# Altium project Master-Board-v2.0.PrjPcb (part 11 of 11)

## Sheet RS485-Sheet.SchDoc
size 420 x 297 mm; SheetNumber: 12; SheetTotal: 15
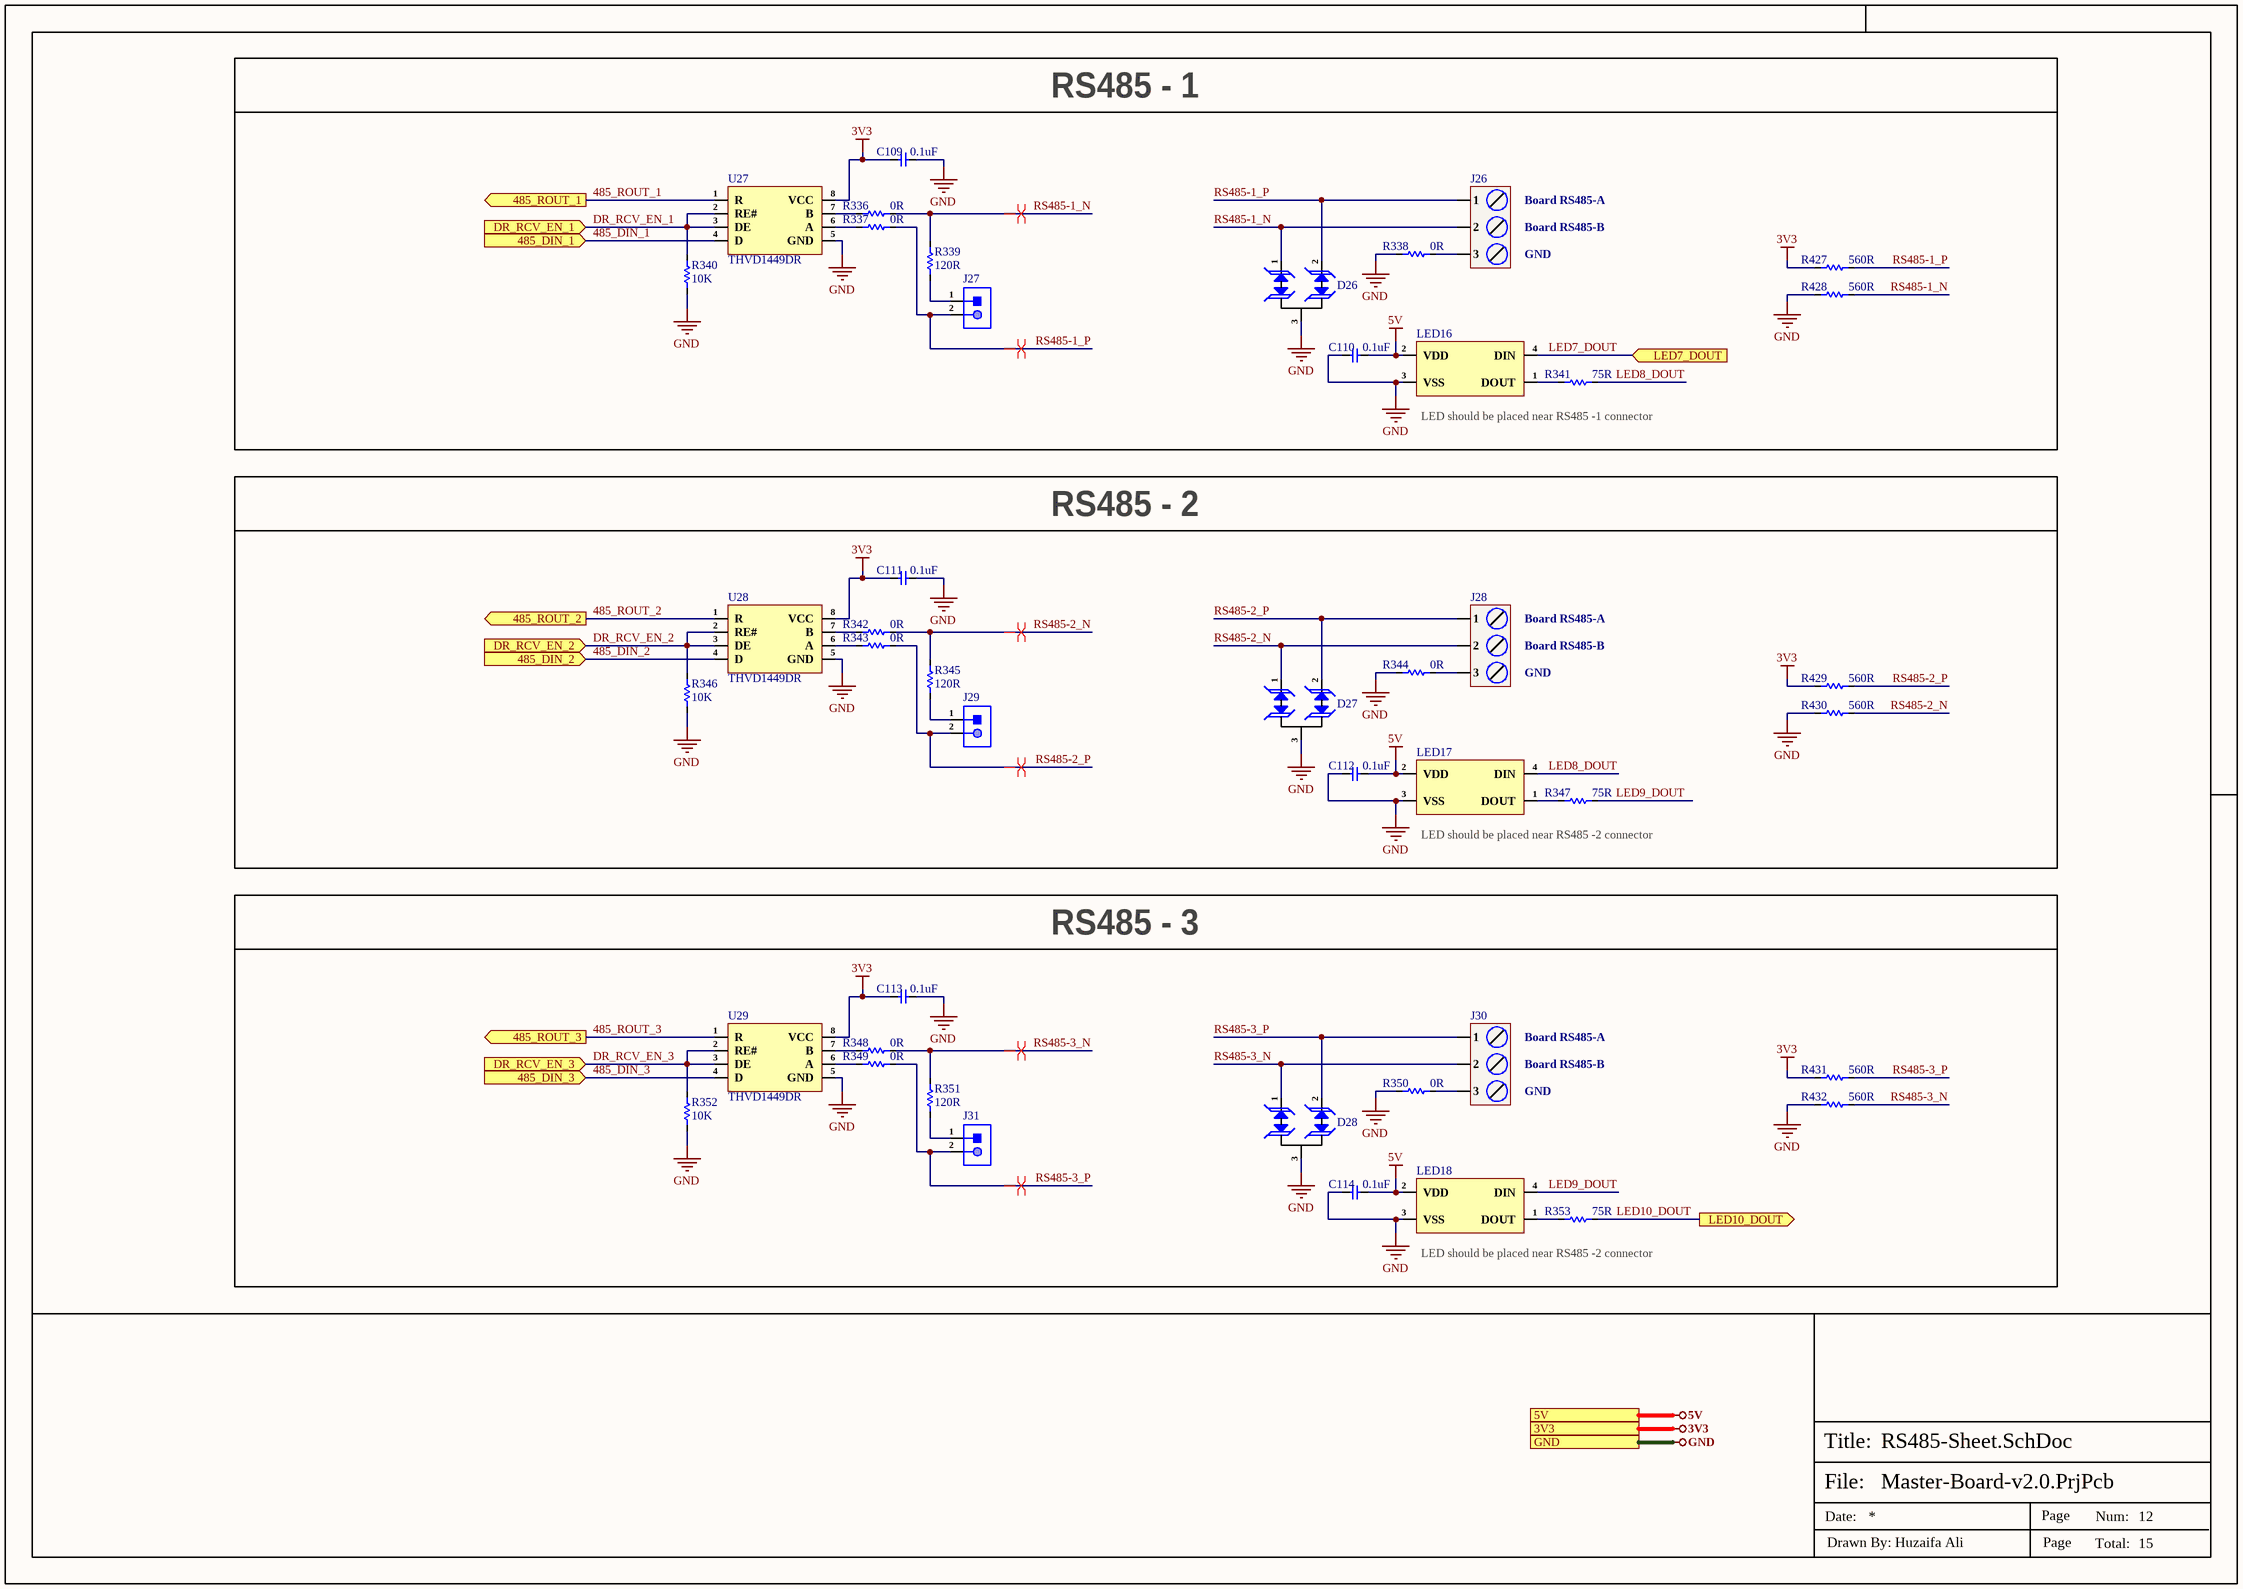
[diagram p13: RS485-Sheet.SchDoc]

### Parts
C109  0.1uF  [Cap-0402]
C110  0.1uF  [Cap-0402]
C111  0.1uF  [Cap-0402]
C112  0.1uF  [Cap-0402]
C113  0.1uF  [Cap-0402]
C114  0.1uF  [Cap-0402]
D26  SM712  [SOT-23]  (value not drawn)
D27  SM712  [SOT-23]  (value not drawn)
D28  SM712  [SOT-23]  (value not drawn)
J26  DB128L-5.08-3P-GY-S  [DB128L-5.08-3P-GY-S]  (value not drawn)
J27  X6511WV-02H-C60D30  [HDR1X2_]  (value not drawn)
J28  DB128L-5.08-3P-GY-S  [DB128L-5.08-3P-GY-S]  (value not drawn)
J29  X6511WV-02H-C60D30  [HDR1X2_]  (value not drawn)
J30  DB128L-5.08-3P-GY-S  [DB128L-5.08-3P-GY-S]  (value not drawn)
J31  X6511WV-02H-C60D30  [HDR1X2_]  (value not drawn)
LED16  WS2812D-F5  [WS2812D-F5]  (value not drawn)
LED17  WS2812D-F5  [WS2812D-F5]  (value not drawn)
LED18  WS2812D-F5  [WS2812D-F5]  (value not drawn)
R336  0R  [Res-0402]
R337  0R  [Res-0402]
R338  0R  [Res-0402]
R339  120R  [Res-0603]
R340  10K  [Res-0402]
R341  75R  [Res-0402]
R342  0R  [Res-0402]
R343  0R  [Res-0402]
R344  0R  [Res-0402]
R345  120R  [Res-0603]
R346  10K  [Res-0402]
R347  75R  [Res-0402]
R348  0R  [Res-0402]
R349  0R  [Res-0402]
R350  0R  [Res-0402]
R351  120R  [Res-0603]
R352  10K  [Res-0402]
R353  75R  [Res-0402]
R427  560R  [Res-0402]
R428  560R  [Res-0402]
R429  560R  [Res-0402]
R430  560R  [Res-0402]
R431  560R  [Res-0402]
R432  560R  [Res-0402]
U27  THVD1449DR  [SOIC-8(0.154", 3.90mm Width)]
U28  THVD1449DR  [SOIC-8(0.154", 3.90mm Width)]
U29  THVD1449DR  [SOIC-8(0.154", 3.90mm Width)]

### Blocks framed on the sheet
RS485 - 1: C109 C110 D26 J26 J27 LED16 R336-R341 R427 R428 U27
RS485 - 2: C111 C112 D27 J28 J29 LED17 R342-R347 R429 R430 U28
RS485 - 3: C113 C114 D28 J30 J31 LED18 R348-R353 R431 R432 U29

### Ports
3V3 (see Top-Sheet[2D], CAN-Sheet[5D], Controller-Sheet-1[4D], Controller-Sheet-2[4D], Controller-Sheet-3[4D], DIOs-Lights-Sensors-Sheet[4D], Display-Sheet[5D], ESP32_Sheet[6D], EtherCAT-Sheet[1D], Ethernet-Sheet[5D], Power-Sheet[4D], RS232-Sheet[5D], STM32-USB-Sheet[4D]), 5V (see Top-Sheet[2D], Analog-AIO-Sheet[5D], CAN-Sheet[5D], Controller-Sheet-2[4D], Controller-Sheet-3[4D], DIOs-Lights-Sensors-Sheet[4D], Display-Sheet[5D], Power-Sheet[4D], RS232-Sheet[5D], STM32-USB-Sheet[4D]), 485_DIN_1 (in, see Top-Sheet[2D]), 485_DIN_2 (in, see Top-Sheet[2D]), 485_DIN_3 (in, see Top-Sheet[2D]), 485_ROUT_1 (out, see Top-Sheet[2D]), 485_ROUT_2 (out, see Top-Sheet[2D]), 485_ROUT_3 (out, see Top-Sheet[2D]), DR_RCV_EN_1 (in, see Top-Sheet[2D]), DR_RCV_EN_2 (in, see Top-Sheet[2D]), DR_RCV_EN_3 (in, see Top-Sheet[2D]), GND (see Top-Sheet[2D], Analog-AIO-Sheet[5D], CAN-Sheet[6D], Controller-Sheet-1[4D], Controller-Sheet-2[4D], Controller-Sheet-3[4D], DIOs-Lights-Sensors-Sheet[4D], Display-Sheet[5D], ESP32_Sheet[6D], EtherCAT-Sheet[1D], Ethernet-Sheet[5D], Power-Sheet[4D], RS232-Sheet[5D], STM32-USB-Sheet[4D]), LED7_DOUT (in, see Top-Sheet[2D], RS232-Sheet[5C]), LED10_DOUT (out, see Top-Sheet[2D])

### Nets
3V3: C109.2 C111.2 C113.2 R427.2 R429.2 R431.2 U27.8(VCC) U28.8(VCC) U29.8(VCC) ; port 3V3
5V: C110.2 C112.2 C114.2 LED16.2(VDD) LED17.2(VDD) LED18.2(VDD) ; port 5V
GND: C109.1 C110.1 C111.1 C112.1 C113.1 C114.1 D26.3(GND) D27.3(GND) D28.3(GND) LED16.3(VSS) LED17.3(VSS) LED18.3(VSS) R338.1 R340.2 R344.1 R346.2 R350.1 R352.2 R428.2 R430.2 R432.2 U27.5(GND) U28.5(GND) U29.5(GND) ; port GND
485_DIN_1: U27.4(D) ; port 485_DIN_1
485_DIN_2: U28.4(D) ; port 485_DIN_2
485_DIN_3: U29.4(D) ; port 485_DIN_3
485_ROUT_1: U27.1(R) ; port 485_ROUT_1
485_ROUT_2: U28.1(R) ; port 485_ROUT_2
485_ROUT_3: U29.1(R) ; port 485_ROUT_3
DR_RCV_EN_1: R340.1 U27.2(RE#) U27.3(DE) ; port DR_RCV_EN_1  [project net DO_PF10]
DR_RCV_EN_2: R346.1 U28.2(RE#) U28.3(DE) ; port DR_RCV_EN_2  [project net DO_PF11]
DR_RCV_EN_3: R352.1 U29.2(RE#) U29.3(DE) ; port DR_RCV_EN_3  [project net DO_PF12]
LED7_DOUT: LED16.4(DIN) ; port LED7_DOUT
LED8_DOUT: LED17.4(DIN) R341.2
LED9_DOUT: LED18.4(DIN) R347.2
LED10_DOUT: R353.2 ; port LED10_DOUT
RS485-1_N: D26.1(I/O1) J26.2 R336.2 R339.2 R428.1
RS485-1_P: D26.2(I/O2) J26.1 J27.2 R337.2 R427.1
RS485-2_N: D27.1(I/O1) J28.2 R342.2 R345.2 R430.1
RS485-2_P: D27.2(I/O2) J28.1 J29.2 R343.2 R429.1
RS485-3_N: D28.1(I/O1) J30.2 R348.2 R351.2 R432.1
RS485-3_P: D28.2(I/O2) J30.1 J31.2 R349.2 R431.1
NetJ26_3: J26.3 R338.2
NetJ27_1: J27.1 R339.1
NetJ28_3: J28.3 R344.2
NetJ29_1: J29.1 R345.1
NetJ30_3: J30.3 R350.2
NetJ31_1: J31.1 R351.1
NetLED16_1: LED16.1(DOUT) R341.1
NetLED17_1: LED17.1(DOUT) R347.1
NetLED18_1: LED18.1(DOUT) R353.1
NetR336_1: R336.1 U27.7(B)
NetR337_1: R337.1 U27.6(A)
NetR342_1: R342.1 U28.7(B)
NetR343_1: R343.1 U28.6(A)
NetR348_1: R348.1 U29.7(B)
NetR349_1: R349.1 U29.6(A)

### Layout directives
differential pair; differential pair class RS485: RS485-1_N, RS485-1_P, RS485-2_N, RS485-2_P, RS485-3_N, RS485-3_P

### Notes on the sheet
- Board RS485-A
- Board RS485-B
- GND
- LED should be placed near RS485 -1 connector
- LED should be placed near RS485 -2 connector
- File:
- Title:
- Date:
- Page
- Num:
- Total:
- Drawn By: Huzaifa Ali

### Library data of the parts
C109-C114 = CC0402JRX7R7BB104: as C115-C124 on sheet EtherCAT-Sheet; Supplier: Digikey; Supplier Part Number: 311-1676-1-ND; Manufacturer Part Number: CC0402JRX7R7BB104; RoHS: Yes; Category: Ceramic Capacitors; Stock: 1659111; Pricing: 1=0.1, 10=0.046, 50=0.0262, 100=0.0203, 500=0.01528, 1000=0.012, 2500=0.01091, 5000=0.01004 (USD); Mounting Technology: Surface Mount; Case/Package: 0402; Case Code (Metric): 1005; Case Code (Imperial): 0402; Min Operating Temperature: -55°C; Max Operating Temperature: 125°C; Dielectric: X7R; Packaging: Tape and Reel; Package Quantity: 10000; Voltage Rating (DC): 16V; Voltage Rating: 16V; Series: CC; Construction: Flat; Length: 0.039inch; Width: 0.02inch; Height: 0.5mm; Thickness: 0.022inch; Lead Free: Lead Free; Halogen Free: Halogen Free; RoHS Compliant: Yes; ComponentLink1URL: https://datasheet.ciiva.com/13210/upy-gphc-x7r-6-3v-to-50v-8-12304-13210152.pdf?src-supplier=Mouser; ComponentLink1Description: https://datasheet.ciiva.com/13210/upy-gphc-x7r-6-3v-to-50v-8-12304-13210152.pdf?src-supplier=Mouser; LCSC Part Number: C541464
D26-D28 = SM712: SOT-23 TVS ROHS; Manufacturer: TECH PUBLIC; Item Type: Diode; Manufacturer Part Number: SM712; Package: SOT-23; LCSC Part Number: C521963; ComponentLink1Description: LCSC; ComponentLink1URL: https://www.lcsc.com/product-detail/TVS_TECH-PUBLIC-SM712_C521963.html
J26 J28 J30 = DB128L-5.08-3P-GY-S: 1x3P 20A -40℃~+105℃ 300V Gray 12~30 Direct Insert 5.08mm 1~2.5 1 3 Plugin,P=5.08mm Screw Terminal Blocks ROHS; Manufacturer: DORABO; Manufacturer Part Number: DB128L-5.08-3P-GY-S; Package: Plugin,P=5.08mm; LCSC Part Number: C500022; Item Type: Terminal Block; ComponentLink1Description: LCSC; ComponentLink1URL: https://www.lcsc.com/product-detail/Screw-Terminal-Blocks_DORABO-DB128L-5-08-3P-GY-S_C500022.html
J27 J29 J31 = X6511WV-02H-C60D30: Gold 250V 3A Straight Square Pins 2.5mm 2P 260℃ 6mm -40℃~+105℃ 3mm 2.54mm Plugin Black Brass 1x2P Plugin,P=2.54mm Pin Headers ROHS; Manufacturer: XKB; Item Type: Male Header; Manufacturer Part Number: X6511WV-02H-C60D30; Package: Plugin,P=2.54mm; LCSC Part Number: C706874; ComponentLink1Description: LCSC; ComponentLink1URL: https://www.lcsc.com/product-detail/Pin-Headers_XKB-Connectivity-X6511WV-02H-C60D30_C706874.html
LED16-LED18 = WS2812D-F5: Plugin,D=5mm RGB LEDs ROHS; Manufacturer: Worldsemi; Item Type: RGB LED; Manufacturer Part Number: WS2812D-F5; Package: Plugin,D=5mm; LCSC Part Number: C190565; ComponentLink1Description: LCSC; ComponentLink1URL: https://jlcpcb.com/partdetail/Worldsemi-WS2812DF5/C190565
R336-R338 R342-R344 R348-R350 = RC0402FR-070RL: as R359 on sheet EtherCAT-Sheet; Supplier 1: Mouser; Manufacturer Part Number: RC0402FR-070RL; RoHS: Yes; Stock 1: 8556842; Pricing 1: 1=0.10000, 10=0.01400, 50=0.01400, 100=0.00600, 1000=0.00300, 5000=0.00200, 10000=0.00100 (USD); Mount: Surface Mount; Case/Package: 0402; Contact Plating: Tin,Matte; Case Code (Imperial): 0402; Case Code (Metric): 1005; Size Code: 0402; Min Operating Temperature: -55°C; Max Operating Temperature: 155°C; Resistance: 0R; Resistor Type: Thick Film; Packaging: Tape and Reel; Termination: SMD/SMT; Features: Moisture Resistant; Series: RC; Number of Terminations: 2; Length: 1mm; Width: 0.5mm; Height: 0.35mm; Radiation Hardening: No; Lead Free: Lead Free; RoHS Compliant: Yes; ComponentLink1URL: https://datasheet.ciiva.com/8896/pyu-rc0402-51-rohs-l-6-8896149.pdf?src-supplier=Avnet; ComponentLink1Description: https://datasheet.ciiva.com/8896/pyu-rc0402-51-rohs-l-6-8896149.pdf?src-supplier=Avnet; ComponentLink2URL: https://datasheet.ciiva.com/16790/pyu-rc0402-51-rohs-l-6-r-16790444.pdf?src-supplier=Future+Electronics; ComponentLink2Description: https://datasheet.ciiva.com/16790/pyu-rc0402-51-rohs-l-6-r-16790444.pdf?src-supplier=Future+Electronics; Supplier Part Number 1: 603-RC0402FR-070RL; LCSC Part Number: C106231
R339 R345 R351 = RC0603FR-07120RL: RES 120 OHM 1% 1/10W 0603; Manufacturer: Yageo; Temperature Coefficient: 100ppm/°C; Voltage Rating (DC): 50V; Power Rating: 100mW; Item Type: Resistor; Supplier 1: Digi-Key; Manufacturer Part Number: RC0603FR-07120RL; RoHS: Yes; Category: Chip SMD Resistors; Stock 1: 839061; Pricing 1: 1=0.10000, 10=0.02400, 100=0.00970, 1000=0.00436, 2500=0.00378 (USD); Case/Package: 0603; Number of Pins: 2; Case Code (Metric): 1608; Case Code (Imperial): 0603; Size Code: 0603; Min Operating Temperature: -55°C; Max Operating Temperature: 155°C; Resistance: 120R; Tolerance: 1%; Resistor Type: Thick Film; Packaging: Tape and Reel; Voltage Rating: 50V; Package Quantity: 1; Number of Terminations: 2; Termination: SMD/SMT; Max Power Dissipation: 100mW; Features: Moisture Resistant; Series: RC; Construction: Rectangular; Resistance Tolerance: 1%; Length: 1.6mm; Width: 0.031inch; Height: 0.022inch; Depth: 0.8mm; REACH SVHC: No SVHC; Lead Free: Lead Free; Military Standard: Not; RoHS Compliant: Yes; ComponentLink1URL: https://datasheet.ciiva.com/2553/pyu-r-int-thick-7-2553512.pdf?src-supplier=Digi-Key; ComponentLink1Description: https://datasheet.ciiva.com/2553/pyu-r-int-thick-7-2553512.pdf?src-supplier=Digi-Key; ComponentLink2URL: https://datasheet.ciiva.com/7746/443971-7746248.pdf?src-supplier=Element14; ComponentLink2Description: https://datasheet.ciiva.com/7746/443971-7746248.pdf?src-supplier=Element14; ComponentLink3URL: https://datasheet.ciiva.com/2553/pyu-r-int-thick-7-2553513.pdf?src-supplier=Digi-Key; ComponentLink3Description: https://datasheet.ciiva.com/2553/pyu-r-int-thick-7-2553513.pdf?src-supplier=Digi-Key; ComponentLink4URL: https://datasheet.ciiva.com/7746/443971-7746249.pdf?src-supplier=Element14; ComponentLink4Description: https://datasheet.ciiva.com/7746/443971-7746249.pdf?src-supplier=Element14; ComponentLink5URL: https://datasheet.ciiva.com/2553/pyu-r-int-thick-7-2553514.pdf?src-supplier=Digi-Key; ComponentLink5Description: https://datasheet.ciiva.com/2553/pyu-r-int-thick-7-2553514.pdf?src-supplier=Digi-Key; ComponentLink6URL: https://datasheet.ciiva.com/46395/443971-46395021.pdf?src-supplier=Element14; ComponentLink6Description: https://datasheet.ciiva.com/46395/443971-46395021.pdf?src-supplier=Element14; Supplier Part Number 1: 311-120HRCT-ND; LCSC Part Number: C114640
R340 R346 R352 = RC0402FR-0710KL: as R354 on sheet EtherCAT-Sheet; Supplier 1: Mouser; Manufacturer Part Number: RC0402FR-0710KL; RoHS: Yes; Category: Chip SMD Resistors; Stock 1: 18648329; Pricing 1: 1=0.10000, 10=0.01400, 50=0.01400, 100=0.00500, 1000=0.00300, 10000=0.00200 (USD); Case/Package: 0402; Number of Pins: 2; Case Code (Imperial): 0402; Case Code (Metric): 1005; Min Operating Temperature: -55°C; Max Operating Temperature: 155°C; Resistor Type: Thick Film; Tolerance: 1%; Packaging: Tape and Reel; Voltage Rating: 50V; Termination: SMD/SMT; Working Voltage: 50V; Number of Terminations: 2; Features: Moisture Resistant; Series: RC; Resistance Tolerance: 1%; Construction: Rectangular; Length: 1mm; Width: 0.5mm; Height: 0.32mm; Depth: 0.5mm; Lead Pitch: 0.2mm; REACH SVHC: No SVHC; Lead Free: Lead Free; RoHS Compliant: Yes; Military Standard: Not; ComponentLink1URL: https://datasheet.ciiva.com/7660/38568-7660787.pdf?src-supplier=Element14; ComponentLink1Description: https://datasheet.ciiva.com/7660/38568-7660787.pdf?src-supplier=Element14; ComponentLink2URL: https://datasheet.ciiva.com/7849/1686128-7849814.pdf?src-supplier=Element14; ComponentLink2Description: https://datasheet.ciiva.com/7849/1686128-7849814.pdf?src-supplier=Element14; ComponentLink3URL: https://datasheet.ciiva.com/7983/1018594-7983486.pdf?src-supplier=Element14; ComponentLink3Description: https://datasheet.ciiva.com/7983/1018594-7983486.pdf?src-supplier=Element14; ComponentLink4URL: https://datasheet.ciiva.com/22747/1018594-22747512.pdf?src-supplier=Element14; ComponentLink4Description: https://datasheet.ciiva.com/22747/1018594-22747512.pdf?src-supplier=Element14; ComponentLink5URL: https://datasheet.ciiva.com/12667/pyu-rc0402-51-rohs-l-6-r-12667067.pdf?src-supplier=Mouser; ComponentLink5Description: https://datasheet.ciiva.com/12667/pyu-rc0402-51-rohs-l-6-r-12667067.pdf?src-supplier=Mouser; ComponentLink6URL: https://datasheet.ciiva.com/7849/1784430-7849813.pdf?src-supplier=Element14; ComponentLink6Description: https://datasheet.ciiva.com/7849/1784430-7849813.pdf?src-supplier=Element14; ComponentLink7URL: https://datasheet.ciiva.com/7849/1784430-7849815.pdf?src-supplier=Element14; ComponentLink7Description: https://datasheet.ciiva.com/7849/1784430-7849815.pdf?src-supplier=Element14; Supplier Part Number 1: 603-RC0402FR-0710KL; LCSC Part Number: C60490
R341 R347 R353 = RC0402JR-0775RL: RES 75 OHM 5% 1/16W 0402; Manufacturer: Yageo; Item Type: Resistor; Temperature Coefficient: 100ppm/°C; Power Rating: 62.5mW; Voltage Rating: 50V; Max Power Dissipation: 63mW; Supplier: Digikey; Supplier Part Number: 311-75JRCT-ND; Manufacturer Part Number: RC0402JR-0775RL; RoHS: Yes; Stock: 2993323; Pricing: 1=0.1, 10=0.018, 50=0.0102, 100=0.0083, 500=0.00528, 1000=0.00444, 5000=0.00307 (USD); Case/Package: 0402; Pins: 2; Contact Plating: Tin,Lead; Case Code (Imperial): 0402; Case Code (Metric): 1005; Min Operating Temperature: -55°C; Max Operating Temperature: 155°C; Value: 75R; Tolerance: 5%; Resistor Type: Thick Film; Packaging: Tape and Reel; Termination: SMD/SMT; Voltage Rating (DC): 50V; Features: Moisture Resistant; Series: RC; Number of Terminations: 2; Resistance Tolerance: 5%; Length: 1mm; Width: 0.5mm; Height: 0.35mm; Reach SVHC Compliant: No; Lead Free: Lead Free; RoHS Compliant: Yes; ComponentLink1URL: https://datasheet.ciiva.com/7983/1018594-7983612.pdf?src-supplier=Element14; ComponentLink1Description: https://datasheet.ciiva.com/7983/1018594-7983612.pdf?src-supplier=Element14; ComponentLink2URL: https://datasheet.ciiva.com/17082/pyu-rc0402-51-rohs-l-6-r-17082239.pdf?src-supplier=Future+Electronics; ComponentLink2Description: https://datasheet.ciiva.com/17082/pyu-rc0402-51-rohs-l-6-r-17082239.pdf?src-supplier=Future+Electronics; LCSC Part Number: C137841
R427-R432 = RC0402FR-07560RL: RES 560 OHM 1% 1/16W 0402; Manufacturer: Yageo; Power Rating: 63mW; Temperature Coefficient: 100ppm/°C; Voltage Rating: 50V; Item Type: Resistor; Supplier: Future Electronics; Supplier Part Number: 8872046; Manufacturer Part Number: RC0402FR-07560RL; RoHS: Yes; Category: Chip SMD Resistors; Stock: 1360000; Pricing: 10000=0.0012, 100000=0.0011, 300000=0.0011, 1250000=0.001, 3000000=0.0009 (USD); Case/Package: 0402; Case Code (Metric): 1005; Case Code (Imperial): 0402; Min Operating Temperature: -55°C; Max Operating Temperature: 155°C; Tolerance: 1%; Packaging: Tape and Reel; Value: 560R; Package Quantity: 1; Resistor Type: Thick Film; Number of Terminations: 2; Termination: SMD/SMT; Max Power Dissipation: 63mW; Features: Moisture Resistant; Series: RC; Construction: Rectangular; Resistance Tolerance: 1%; Length: 1mm; Width: 0.02inch; Height: 0.016inch; Depth: 0.5mm; RoHS Compliant: Yes; Military Standard: Not; Lead Free: Lead Free; Reach SVHC Compliant: Unknown; ComponentLink1URL: https://datasheet.ciiva.com/2453/pyu-r-int-thick-7-2453458.pdf?src-supplier=Digikey; ComponentLink1Description: https://datasheet.ciiva.com/2453/pyu-r-int-thick-7-2453458.pdf?src-supplier=Digikey; ComponentLink2URL: https://datasheet.ciiva.com/2453/pyu-r-int-thick-7-2453459.pdf?src-supplier=Digikey; ComponentLink2Description: https://datasheet.ciiva.com/2453/pyu-r-int-thick-7-2453459.pdf?src-supplier=Digikey; ComponentLink3URL: https://datasheet.ciiva.com/2453/pyu-r-int-thick-7-2453457.pdf?src-supplier=Digikey; ComponentLink3Description: https://datasheet.ciiva.com/2453/pyu-r-int-thick-7-2453457.pdf?src-supplier=Digikey; ComponentLink4URL: https://datasheet.ciiva.com/12558/pyu-rc0402-51-rohs-l-6-r-8721-12558383.pdf?src-supplier=Mouser; ComponentLink4Description: https://datasheet.ciiva.com/12558/pyu-rc0402-51-rohs-l-6-r-8721-12558383.pdf?src-supplier=Mouser; ComponentLink5URL: https://datasheet.ciiva.com/7850/1018594-7850042.pdf?src-supplier=Element14; ComponentLink5Description: https://datasheet.ciiva.com/7850/1018594-7850042.pdf?src-supplier=Element14; ComponentLink6URL: https://datasheet.ciiva.com/7850/1018594-7850043.pdf?src-supplier=Element14; ComponentLink6Description: https://datasheet.ciiva.com/7850/1018594-7850043.pdf?src-supplier=Element14; LCSC Part Number: C163460
U27-U29 = THVD1449DR: IC TRANSCEIVER HALF 1/1 8SOIC; Manufacturer: Texas Instruments; Supplier: Mouser; LCSC Part Number: C3235059; Manufacturer Part Number: THVD1449DR; RoHS: No; Item Type: IC; Stock: 7454; Pricing: 1=3.62, 10=2.51, 50=2.51, 100=2.27, 1000=2.02, 10000=1.95 (USD)

## Sheet RS232-Sheet.SchDoc
size 420 x 297 mm; SheetNumber: 11; SheetTotal: 15
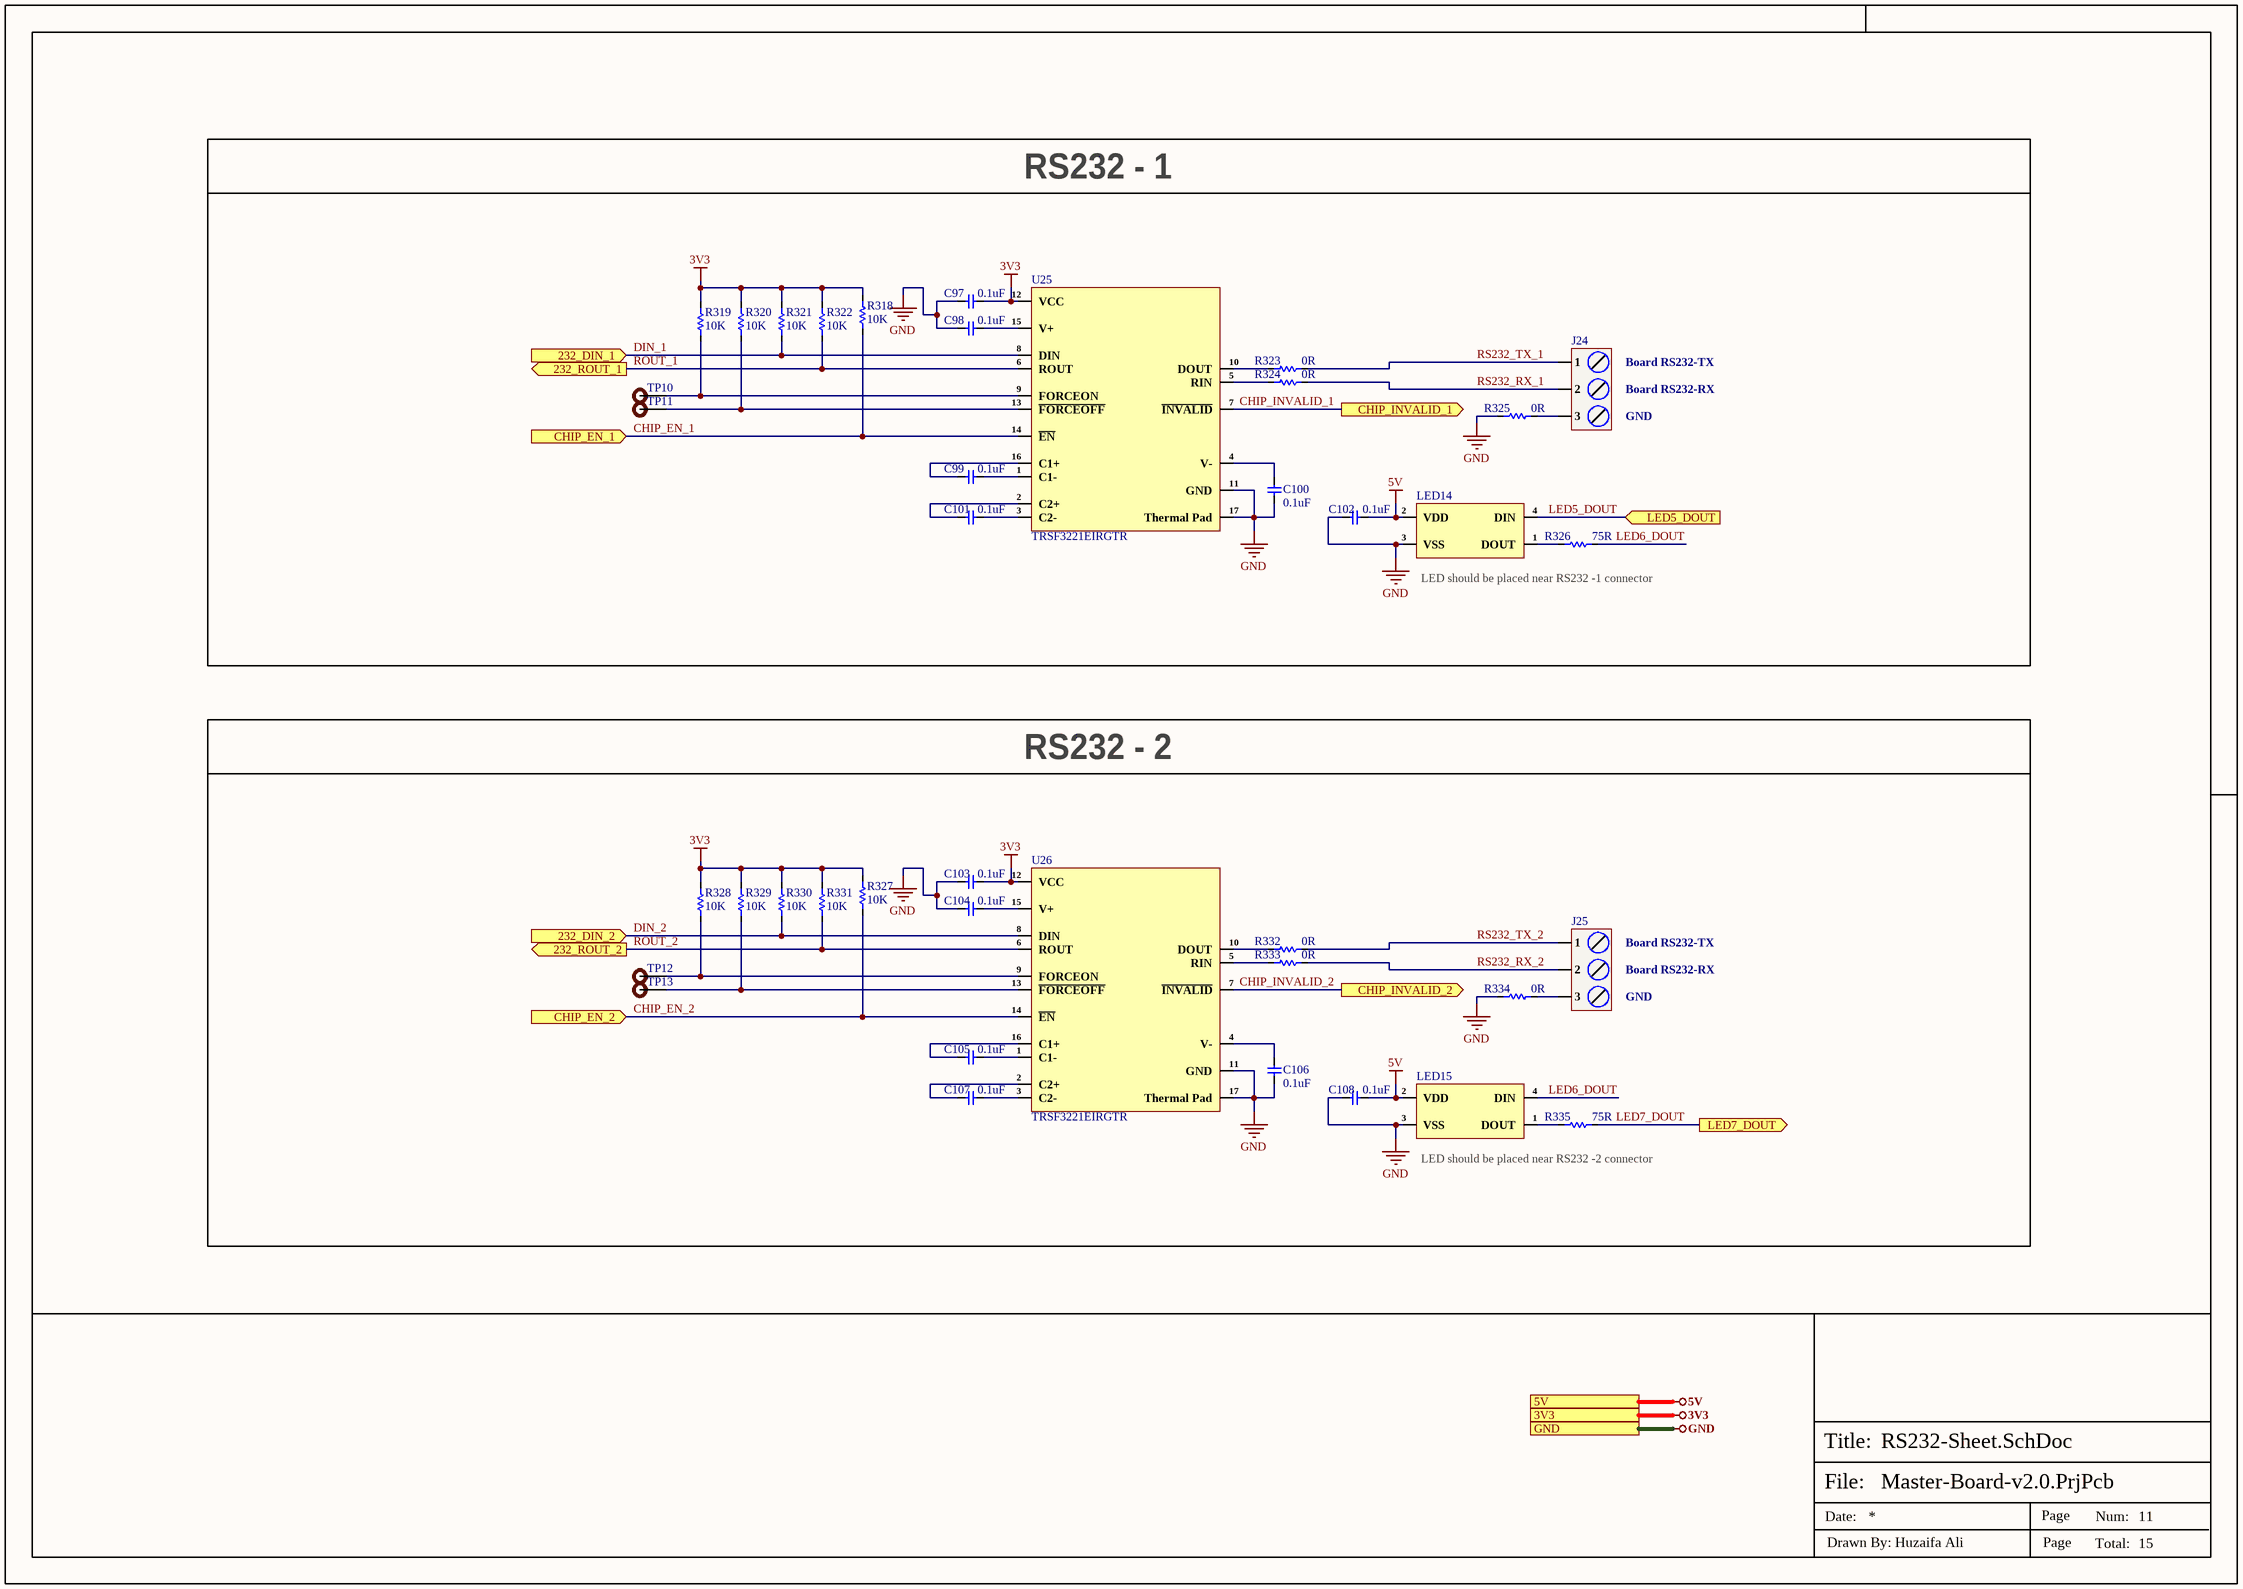
[diagram p14: RS232-Sheet.SchDoc]

### Parts
C97  0.1uF  [Cap-0402]
C98  0.1uF  [Cap-0402]
C99  0.1uF  [Cap-0402]
C100  0.1uF  [Cap-0402]
C101  0.1uF  [Cap-0402]
C102  0.1uF  [Cap-0402]
C103  0.1uF  [Cap-0402]
C104  0.1uF  [Cap-0402]
C105  0.1uF  [Cap-0402]
C106  0.1uF  [Cap-0402]
C107  0.1uF  [Cap-0402]
C108  0.1uF  [Cap-0402]
J24  DB128L-5.08-3P-GN-S  [DB128L-5.08-3P-GN-S]  (value not drawn)
J25  DB128L-5.08-3P-GN-S  [DB128L-5.08-3P-GN-S]  (value not drawn)
LED14  WS2812D-F5  [WS2812D-F5]  (value not drawn)
LED15  WS2812D-F5  [WS2812D-F5]  (value not drawn)
R318  10K  [Res-0402]
R319  10K  [Res-0402]
R320  10K  [Res-0402]
R321  10K  [Res-0402]
R322  10K  [Res-0402]
R323  0R  [Res-0402]
R324  0R  [Res-0402]
R325  0R  [Res-0402]
R326  75R  [Res-0402]
R327  10K  [Res-0402]
R328  10K  [Res-0402]
R329  10K  [Res-0402]
R330  10K  [Res-0402]
R331  10K  [Res-0402]
R332  0R  [Res-0402]
R333  0R  [Res-0402]
R334  0R  [Res-0402]
R335  75R  [Res-0402]
TP10  TEST POINT  [Test-point]  (value not drawn)  (no BOM)
TP11  TEST POINT  [Test-point]  (value not drawn)  (no BOM)
TP12  TEST POINT  [Test-point]  (value not drawn)  (no BOM)
TP13  TEST POINT  [Test-point]  (value not drawn)  (no BOM)
U25  TRSF3221EIRGTR  [16-QFN (3x3).]
U26  TRSF3221EIRGTR  [16-QFN (3x3).]

### Blocks framed on the sheet
RS232 - 1: C97-C102 J24 LED14 R318-R326 TP10 TP11 U25
RS232 - 2: C103-C108 J25 LED15 R327-R335 TP12 TP13 U26

### Ports
3V3 (see Top-Sheet[5B], CAN-Sheet[5D], Controller-Sheet-1[4D], Controller-Sheet-2[4D], Controller-Sheet-3[4D], DIOs-Lights-Sensors-Sheet[4D], Display-Sheet[5D], ESP32_Sheet[6D], EtherCAT-Sheet[1D], Ethernet-Sheet[5D], Power-Sheet[4D], RS485-Sheet[5D], STM32-USB-Sheet[4D]), 5V (see Top-Sheet[5B], Analog-AIO-Sheet[5D], CAN-Sheet[5D], Controller-Sheet-2[4D], Controller-Sheet-3[4D], DIOs-Lights-Sensors-Sheet[4D], Display-Sheet[5D], Power-Sheet[4D], RS485-Sheet[5D], STM32-USB-Sheet[4D]), 232_DIN_1 (in, see Top-Sheet[5B]), 232_DIN_2 (in, see Top-Sheet[5B]), 232_ROUT_1 (out, see Top-Sheet[5B]), 232_ROUT_2 (out, see Top-Sheet[5B]), CHIP_EN_1 (in, see Top-Sheet[5B]), CHIP_EN_2 (in, see Top-Sheet[5B]), CHIP_INVALID_1 (out, see Top-Sheet[5B]), CHIP_INVALID_2 (out, see Top-Sheet[5B]), GND (see Top-Sheet[5B], Analog-AIO-Sheet[5D], CAN-Sheet[6D], Controller-Sheet-1[4D], Controller-Sheet-2[4D], Controller-Sheet-3[4D], DIOs-Lights-Sensors-Sheet[4D], Display-Sheet[5D], ESP32_Sheet[6D], EtherCAT-Sheet[1D], Ethernet-Sheet[5D], Power-Sheet[4D], RS485-Sheet[5D], STM32-USB-Sheet[4D]), LED5_DOUT (in, see Top-Sheet[5B], CAN-Sheet[5D]), LED7_DOUT (out, see Top-Sheet[5B], RS485-Sheet[5A])

### Nets
3V3: C97.1 C103.1 R318.1 R319.1 R320.1 R321.1 R322.1 R327.1 R328.1 R329.1 R330.1 R331.1 U25.12(VCC) U26.12(VCC) ; port 3V3
5V: C102.2 C108.2 LED14.2(VDD) LED15.2(VDD) ; port 5V
GND: C97.2 C98.2 C100.2 C102.1 C103.2 C104.2 C106.2 C108.1 LED14.3(VSS) LED15.3(VSS) R325.1 R334.1 U25.11(GND) U25.17(Thermal_Pad) U26.11(GND) U26.17(Thermal_Pad) ; port GND
CHIP_EN_1: R318.2 U25.14(~{EN}) ; port CHIP_EN_1
CHIP_EN_2: R327.2 U26.14(~{EN}) ; port CHIP_EN_2
CHIP_INVALID_1: U25.7(~{INVALID}) ; port CHIP_INVALID_1
CHIP_INVALID_2: U26.7(~{INVALID}) ; port CHIP_INVALID_2
DIN_1: R321.2 U25.8(DIN) ; port 232_DIN_1
DIN_2: R330.2 U26.8(DIN) ; port 232_DIN_2
LED5_DOUT: LED14.4(DIN) ; port LED5_DOUT
LED6_DOUT: LED15.4(DIN) R326.2
LED7_DOUT: R335.2 ; port LED7_DOUT
ROUT_1: R322.2 U25.6(ROUT) ; port 232_ROUT_1
ROUT_2: R331.2 U26.6(ROUT) ; port 232_ROUT_2
RS232_RX_1: J24.2 R324.1
RS232_RX_2: J25.2 R333.1
RS232_TX_1: J24.1 R323.1
RS232_TX_2: J25.1 R332.1
NetC98_1: C98.1 U25.15(V+)
NetC99_1: C99.1 U25.1(C1-)
NetC99_2: C99.2 U25.16(C1+)
NetC100_1: C100.1 U25.4(V-)
NetC101_1: C101.1 U25.3(C2-)
NetC101_2: C101.2 U25.2(C2+)
NetC104_1: C104.1 U26.15(V+)
NetC105_1: C105.1 U26.1(C1-)
NetC105_2: C105.2 U26.16(C1+)
NetC106_1: C106.1 U26.4(V-)
NetC107_1: C107.1 U26.3(C2-)
NetC107_2: C107.2 U26.2(C2+)
NetJ24_3: J24.3 R325.2
NetJ25_3: J25.3 R334.2
NetLED14_1: LED14.1(DOUT) R326.1
NetLED15_1: LED15.1(DOUT) R335.1
NetR319_2: R319.2 TP10.1 U25.9(FORCEON)
NetR320_2: R320.2 TP11.1 U25.13(~{FORCEOFF})
NetR323_2: R323.2 U25.10(DOUT)
NetR324_2: R324.2 U25.5(RIN)
NetR328_2: R328.2 TP12.1 U26.9(FORCEON)
NetR329_2: R329.2 TP13.1 U26.13(~{FORCEOFF})
NetR332_2: R332.2 U26.10(DOUT)
NetR333_2: R333.2 U26.5(RIN)

### Notes on the sheet
- Board RS232-TX
- Board RS232-RX
- GND
- LED should be placed near RS232 -1 connector
- LED should be placed near RS232 -2 connector
- File:
- Title:
- Date:
- Page
- Num:
- Total:
- Drawn By: Huzaifa Ali

### Library data of the parts
C97-C108 = CC0402JRX7R7BB104: as C115-C124 on sheet EtherCAT-Sheet; Supplier: Digikey; Supplier Part Number: 311-1676-1-ND; Manufacturer Part Number: CC0402JRX7R7BB104; RoHS: Yes; Category: Ceramic Capacitors; Stock: 1659111; Pricing: 1=0.1, 10=0.046, 50=0.0262, 100=0.0203, 500=0.01528, 1000=0.012, 2500=0.01091, 5000=0.01004 (USD); Mounting Technology: Surface Mount; Case/Package: 0402; Case Code (Metric): 1005; Case Code (Imperial): 0402; Min Operating Temperature: -55°C; Max Operating Temperature: 125°C; Dielectric: X7R; Packaging: Tape and Reel; Package Quantity: 10000; Voltage Rating (DC): 16V; Voltage Rating: 16V; Series: CC; Construction: Flat; Length: 0.039inch; Width: 0.02inch; Height: 0.5mm; Thickness: 0.022inch; Lead Free: Lead Free; Halogen Free: Halogen Free; RoHS Compliant: Yes; ComponentLink1URL: https://datasheet.ciiva.com/13210/upy-gphc-x7r-6-3v-to-50v-8-12304-13210152.pdf?src-supplier=Mouser; ComponentLink1Description: https://datasheet.ciiva.com/13210/upy-gphc-x7r-6-3v-to-50v-8-12304-13210152.pdf?src-supplier=Mouser; LCSC Part Number: C541464
J24 J25 = DB128L-5.08-3P-GN-S: 1x3P 18A -40℃~+105℃ 250V Green 12~30 Direct Insert 5.08mm 2.5 1 3 Plugin,P=5.08mm Screw Terminal Blocks ROHS; Manufacturer: DORABO; Manufacturer Part Number: DB128L-5.08-3P-GN-S; Package: Plugin,P=5.08mm; LCSC Part Number: C395869; Item Type: Terminal Block; ComponentLink1Description: LCSC; ComponentLink1URL: https://www.lcsc.com/product-detail/Screw-Terminal-Blocks_DORABO-DB128L-5-08-3P-GN-S_C395869.html
LED14 LED15 = WS2812D-F5: as LED16-LED18 on sheet RS485-Sheet; Manufacturer Part Number: WS2812D-F5; Package: Plugin,D=5mm; LCSC Part Number: C190565; ComponentLink1Description: LCSC; ComponentLink1URL: https://jlcpcb.com/partdetail/Worldsemi-WS2812DF5/C190565
R318-R322 R327-R331 = RC0402FR-0710KL: as R354 on sheet EtherCAT-Sheet; Supplier 1: Mouser; Manufacturer Part Number: RC0402FR-0710KL; RoHS: Yes; Category: Chip SMD Resistors; Stock 1: 18648329; Pricing 1: 1=0.10000, 10=0.01400, 50=0.01400, 100=0.00500, 1000=0.00300, 10000=0.00200 (USD); Case/Package: 0402; Number of Pins: 2; Case Code (Imperial): 0402; Case Code (Metric): 1005; Min Operating Temperature: -55°C; Max Operating Temperature: 155°C; Resistor Type: Thick Film; Tolerance: 1%; Packaging: Tape and Reel; Voltage Rating: 50V; Termination: SMD/SMT; Working Voltage: 50V; Number of Terminations: 2; Features: Moisture Resistant; Series: RC; Resistance Tolerance: 1%; Construction: Rectangular; Length: 1mm; Width: 0.5mm; Height: 0.32mm; Depth: 0.5mm; Lead Pitch: 0.2mm; REACH SVHC: No SVHC; Lead Free: Lead Free; RoHS Compliant: Yes; Military Standard: Not; ComponentLink1URL: https://datasheet.ciiva.com/7660/38568-7660787.pdf?src-supplier=Element14; ComponentLink1Description: https://datasheet.ciiva.com/7660/38568-7660787.pdf?src-supplier=Element14; ComponentLink2URL: https://datasheet.ciiva.com/7849/1686128-7849814.pdf?src-supplier=Element14; ComponentLink2Description: https://datasheet.ciiva.com/7849/1686128-7849814.pdf?src-supplier=Element14; ComponentLink3URL: https://datasheet.ciiva.com/7983/1018594-7983486.pdf?src-supplier=Element14; ComponentLink3Description: https://datasheet.ciiva.com/7983/1018594-7983486.pdf?src-supplier=Element14; ComponentLink4URL: https://datasheet.ciiva.com/22747/1018594-22747512.pdf?src-supplier=Element14; ComponentLink4Description: https://datasheet.ciiva.com/22747/1018594-22747512.pdf?src-supplier=Element14; ComponentLink5URL: https://datasheet.ciiva.com/12667/pyu-rc0402-51-rohs-l-6-r-12667067.pdf?src-supplier=Mouser; ComponentLink5Description: https://datasheet.ciiva.com/12667/pyu-rc0402-51-rohs-l-6-r-12667067.pdf?src-supplier=Mouser; ComponentLink6URL: https://datasheet.ciiva.com/7849/1784430-7849813.pdf?src-supplier=Element14; ComponentLink6Description: https://datasheet.ciiva.com/7849/1784430-7849813.pdf?src-supplier=Element14; ComponentLink7URL: https://datasheet.ciiva.com/7849/1784430-7849815.pdf?src-supplier=Element14; ComponentLink7Description: https://datasheet.ciiva.com/7849/1784430-7849815.pdf?src-supplier=Element14; Supplier Part Number 1: 603-RC0402FR-0710KL; LCSC Part Number: C60490
R323-R325 R332-R334 = RC0402FR-070RL: as R359 on sheet EtherCAT-Sheet; Supplier 1: Mouser; Manufacturer Part Number: RC0402FR-070RL; RoHS: Yes; Stock 1: 8556842; Pricing 1: 1=0.10000, 10=0.01400, 50=0.01400, 100=0.00600, 1000=0.00300, 5000=0.00200, 10000=0.00100 (USD); Mount: Surface Mount; Case/Package: 0402; Contact Plating: Tin,Matte; Case Code (Imperial): 0402; Case Code (Metric): 1005; Size Code: 0402; Min Operating Temperature: -55°C; Max Operating Temperature: 155°C; Resistance: 0R; Resistor Type: Thick Film; Packaging: Tape and Reel; Termination: SMD/SMT; Features: Moisture Resistant; Series: RC; Number of Terminations: 2; Length: 1mm; Width: 0.5mm; Height: 0.35mm; Radiation Hardening: No; Lead Free: Lead Free; RoHS Compliant: Yes; ComponentLink1URL: https://datasheet.ciiva.com/8896/pyu-rc0402-51-rohs-l-6-8896149.pdf?src-supplier=Avnet; ComponentLink1Description: https://datasheet.ciiva.com/8896/pyu-rc0402-51-rohs-l-6-8896149.pdf?src-supplier=Avnet; ComponentLink2URL: https://datasheet.ciiva.com/16790/pyu-rc0402-51-rohs-l-6-r-16790444.pdf?src-supplier=Future+Electronics; ComponentLink2Description: https://datasheet.ciiva.com/16790/pyu-rc0402-51-rohs-l-6-r-16790444.pdf?src-supplier=Future+Electronics; Supplier Part Number 1: 603-RC0402FR-070RL; LCSC Part Number: C106231
R326 R335 = RC0402JR-0775RL: as R341 on sheet RS485-Sheet; Supplier: Digikey; Supplier Part Number: 311-75JRCT-ND; Manufacturer Part Number: RC0402JR-0775RL; RoHS: Yes; Stock: 2993323; Pricing: 1=0.1, 10=0.018, 50=0.0102, 100=0.0083, 500=0.00528, 1000=0.00444, 5000=0.00307 (USD); Case/Package: 0402; Pins: 2; Contact Plating: Tin,Lead; Case Code (Imperial): 0402; Case Code (Metric): 1005; Min Operating Temperature: -55°C; Max Operating Temperature: 155°C; Value: 75R; Tolerance: 5%; Resistor Type: Thick Film; Packaging: Tape and Reel; Termination: SMD/SMT; Voltage Rating (DC): 50V; Features: Moisture Resistant; Series: RC; Number of Terminations: 2; Resistance Tolerance: 5%; Length: 1mm; Width: 0.5mm; Height: 0.35mm; Reach SVHC Compliant: No; Lead Free: Lead Free; RoHS Compliant: Yes; ComponentLink1URL: https://datasheet.ciiva.com/7983/1018594-7983612.pdf?src-supplier=Element14; ComponentLink1Description: https://datasheet.ciiva.com/7983/1018594-7983612.pdf?src-supplier=Element14; ComponentLink2URL: https://datasheet.ciiva.com/17082/pyu-rc0402-51-rohs-l-6-r-17082239.pdf?src-supplier=Future+Electronics; ComponentLink2Description: https://datasheet.ciiva.com/17082/pyu-rc0402-51-rohs-l-6-r-17082239.pdf?src-supplier=Future+Electronics; LCSC Part Number: C137841
TP10-TP13 = TEST POINT: Test Point ON; Item Type: TEST POINT
U25 U26 = TRSF3221EIRGTR: IC TRANSCEIVER FULL 1/1 16VQFN; Manufacturer: Texas Instruments; Supplier: Mouser; LCSC Part Number: C2861230; Manufacturer Part Number: TRSF3221EIRGTR; RoHS: No; Item Type: IC; Stock: 8746; Pricing: 1=2.41, 10=1.64, 50=1.64, 100=1.47, 1000=1.3, 10000=1.24 (USD)

## Nets that join several sheets
3V3: Power-Sheet (D10.2 F1.2 R76.1 TP3.1), ESP32_Sheet (34 pins), Ethernet-Sheet (19 pins), Display-Sheet (10 pins), Controller-Sheet-2 (8 pins), CAN-Sheet (12 pins), DIOs-Lights-Sensors-Sheet (R406.2 R407.2 R412.2 R413.2), Controller-Sheet-3 (5 pins), EtherCAT-Sheet (27 pins), Controller-Sheet-1 (26 pins), STM32-USB-Sheet (9 pins), RS485-Sheet (9 pins), RS232-Sheet (14 pins)
5V: Power-Sheet (13 pins), ESP32_Sheet (6 pins), Display-Sheet (C30.1 J10.3), Controller-Sheet-2 (R201.2), CAN-Sheet (10 pins), DIOs-Lights-Sensors-Sheet (5 pins), Controller-Sheet-3 (C80.1 R254.2 R255.2 U17.7), Analog-AIO-Sheet (8 pins), STM32-USB-Sheet (U18.5), RS485-Sheet (6 pins), RS232-Sheet (C102.2 C108.2 LED14.2 LED15.2)
+24V: Power-Sheet (13 pins), ESP32_Sheet (R31.1 R32.1 R44.1 R45.1), DIOs-Lights-Sensors-Sheet (12 pins)
GND: Power-Sheet (33 pins), ESP32_Sheet (44 pins), Ethernet-Sheet (51 pins), Display-Sheet (8 pins), Controller-Sheet-2 (16 pins), CAN-Sheet (38 pins), DIOs-Lights-Sensors-Sheet (50 pins), Controller-Sheet-3 (C80.2 C81.1 J15.3 U17.2), Analog-AIO-Sheet (28 pins), EtherCAT-Sheet (46 pins), Controller-Sheet-1 (26 pins), STM32-USB-Sheet (21 pins), RS485-Sheet (24 pins), RS232-Sheet (16 pins)
SHGND: Power-Sheet (J9.3), ESP32_Sheet (J1.S1 J1.S2 J1.S3 J1.S4), Ethernet-Sheet (J12.13 J12.14 J13.13 J13.14), EtherCAT-Sheet (6 pins), STM32-USB-Sheet (7 pins)
5V-ESP-SCL: ESP32_Sheet (R50.1 R66.1), Display-Sheet (J10.2)
5V-ESP-SDA: ESP32_Sheet (R51.1 R65.1), Display-Sheet (J10.1)
5V_I2C4_SCL: Controller-Sheet-3 (R254.1 R260.1), Analog-AIO-Sheet (R417.2 R421.2)
5V_I2C4_SDA: Controller-Sheet-3 (R255.1 R259.1), Analog-AIO-Sheet (R418.2 R422.2)
485_DIN_1: Controller-Sheet-3 (R213.2), RS485-Sheet (U27.4)
485_DIN_2: Controller-Sheet-2 (R190.2), RS485-Sheet (U28.4)
485_DIN_3: Controller-Sheet-2 (R198.2), RS485-Sheet (U29.4)
485_ROUT_1: Controller-Sheet-3 (R215.2), RS485-Sheet (U27.1)
485_ROUT_2: Controller-Sheet-2 (R191.2), RS485-Sheet (U28.1)
485_ROUT_3: Controller-Sheet-3 (R205.2), RS485-Sheet (U29.1)
BUZ_EN: DIOs-Lights-Sensors-Sheet (R392.1), Controller-Sheet-3 (R226.2)
CAN0_N: ESP32_Sheet (J7.2 R61.2), CAN-Sheet (J23.2 R310.2)
CAN0_P: ESP32_Sheet (R57.2 R62.2), CAN-Sheet (R307.2 R311.2)
CAN1_RXD: CAN-Sheet (R284.1), Controller-Sheet-3 (R203.2)
CAN1_SHDN: CAN-Sheet (R287.1), Controller-Sheet-3 (R228.2)
CAN1_STB: CAN-Sheet (R281.1), Controller-Sheet-3 (R230.2)
CAN1_TXD: CAN-Sheet (R282.1), Controller-Sheet-3 (R204.2)
CAN2_RXD: Controller-Sheet-2 (R166.1), CAN-Sheet (R299.1)
CAN2_SHDN: CAN-Sheet (R302.1), Controller-Sheet-3 (R232.2)
CAN2_STB: CAN-Sheet (R294.1), Controller-Sheet-3 (R234.2)
CAN2_TXD: Controller-Sheet-2 (R182.1), CAN-Sheet (R297.1)
CAN3_RXD: CAN-Sheet (R309.1), Controller-Sheet-3 (R221.2)
CAN3_SHDN: CAN-Sheet (R312.1), Controller-Sheet-3 (R236.2)
CAN3_STB: CAN-Sheet (R305.1), Controller-Sheet-3 (R238.2)
CAN3_TXD: CAN-Sheet (R306.1), Controller-Sheet-3 (R222.2)
CHIP_EN_1: Controller-Sheet-3 (R249.1), RS232-Sheet (R318.2 U25.14)
CHIP_EN_2: Controller-Sheet-3 (R251.1), RS232-Sheet (R327.2 U26.14)
CHIP_INVALID_1: Controller-Sheet-3 (R242.1), RS232-Sheet (U25.7)
CHIP_INVALID_2: Controller-Sheet-3 (R243.1), RS232-Sheet (U26.7)
CRS_DV: ESP32_Sheet (R35.1), Ethernet-Sheet (R121.2)
DI_PE13: DIOs-Lights-Sensors-Sheet (R412.1 U34.4), Controller-Sheet-3 (R223.1)
DI_PE14: DIOs-Lights-Sensors-Sheet (R407.1 U33.4), Controller-Sheet-3 (R225.1)
DI_PE15: DIOs-Lights-Sensors-Sheet (R413.1 U35.4), Controller-Sheet-3 (R227.1)
DI_PG0: DIOs-Lights-Sensors-Sheet (R406.1 U32.4), Controller-Sheet-3 (R229.1)
DI_PG1: DIOs-Lights-Sensors-Sheet (D61.2 R405.1), Controller-Sheet-3 (R231.1)
DI_PG2: DIOs-Lights-Sensors-Sheet (D64.2 R410.1), Controller-Sheet-3 (R233.1)
DI_PG3: DIOs-Lights-Sensors-Sheet (D65.2 R411.1), Controller-Sheet-3 (R235.1)
DI_PG4: DIOs-Lights-Sensors-Sheet (D68.2 R416.1), Controller-Sheet-3 (R237.1)
DIN_1: Controller-Sheet-2 (R168.1), RS232-Sheet (R321.2 U25.8)
DIN_2: Controller-Sheet-3 (R208.2), RS232-Sheet (R330.2 U26.8)
DIO_PA0: Controller-Sheet-2 (R152.2), DIOs-Lights-Sensors-Sheet (D37.2 D44.2 R393.1)
DIO_PA1: Controller-Sheet-2 (R154.2), DIOs-Lights-Sensors-Sheet (D38.2 D45.2 R395.1)
DIO_PA2: Controller-Sheet-2 (R159.2), DIOs-Lights-Sensors-Sheet (D39.2 D46.2 R397.1)
DIO_PA3: Controller-Sheet-2 (R161.2), DIOs-Lights-Sensors-Sheet (D40.2 D47.2 R399.1)
DIO_PA4: Controller-Sheet-2 (R163.2), EtherCAT-Sheet (U30.34)
DIO_PA5: Controller-Sheet-2 (R165.2), EtherCAT-Sheet (U30.18)
DIO_PA6: Controller-Sheet-2 (R167.2), DIOs-Lights-Sensors-Sheet (D41.2 D48.2 R401.1)
DIO_PA7: Controller-Sheet-2 (R169.2), DIOs-Lights-Sensors-Sheet (D42.2 D49.2 R403.1)
DIO_PB2: ESP32_Sheet (R17.1), Controller-Sheet-2 (R160.1)
DIO_PC0: Controller-Sheet-2 (R186.2), DIOs-Lights-Sensors-Sheet (D43.2 D50.2 R404.1)
DIO_PC1: Controller-Sheet-2 (R187.2), DIOs-Lights-Sensors-Sheet (D51.2 D56.2 R394.1)
DIO_PC4: Controller-Sheet-2 (R188.2), DIOs-Lights-Sensors-Sheet (D52.2 D57.2 R396.1)
DIO_PC5: Controller-Sheet-2 (R189.2), DIOs-Lights-Sensors-Sheet (D53.2 D58.2 R398.1)
DIO_PC8: Controller-Sheet-2 (R192.2), DIOs-Lights-Sensors-Sheet (D54.2 D59.2 R400.1)
DIO_PC9: Controller-Sheet-2 (R193.2), DIOs-Lights-Sensors-Sheet (D55.2 D60.2 R402.1)
DO_PD11: DIOs-Lights-Sensors-Sheet (R390.1), Controller-Sheet-3 (R219.2)
DO_PD14: DIOs-Lights-Sensors-Sheet (R391.1), Controller-Sheet-3 (R224.2)
DO_PE7: Display-Sheet (J11.6 R84.1), Controller-Sheet-3 (R212.1)
DO_PE8: Display-Sheet (R89.1), Controller-Sheet-3 (R214.1)
DO_PE9: Display-Sheet (R77.1), Controller-Sheet-3 (R216.1)
DO_PE10: Display-Sheet (R79.1), Controller-Sheet-3 (R218.1)
DO_PE11: Display-Sheet (R81.1), Controller-Sheet-3 (R220.1)
DO_PF10: Controller-Sheet-3 (R244.2), RS485-Sheet (R340.1 U27.2 U27.3)
DO_PF11: Controller-Sheet-3 (R245.2), RS485-Sheet (R346.1 U28.2 U28.3)
DO_PF12: Controller-Sheet-3 (R246.2), RS485-Sheet (R352.1 U29.2 U29.3)
DO_PF13: DIOs-Lights-Sensors-Sheet (R389.1), Controller-Sheet-3 (R247.2)
ESP_EXP_IO6: ESP32_Sheet (R16.1), Controller-Sheet-2 (5 pins)
ETHCAT_CS: Controller-Sheet-2 (R180.1), EtherCAT-Sheet (R381.2)
ETHCAT_MISO: Controller-Sheet-2 (R184.1), EtherCAT-Sheet (R382.2)
ETHCAT_MOSI: Controller-Sheet-2 (R185.1), EtherCAT-Sheet (R383.2)
ETHCAT_SCK: Controller-Sheet-2 (R176.1), EtherCAT-Sheet (R379.2)
IO14: ESP32_Sheet (U2.13), Controller-Sheet-3 (R240.2)
IO15: ESP32_Sheet (U2.14), Controller-Sheet-3 (R239.2)
LED1_DIN: Controller-Sheet-2 (R202.2), CAN-Sheet (LED9.4)
LED5_DOUT: CAN-Sheet (R317.2), RS232-Sheet (LED14.4)
LED7_DOUT: RS485-Sheet (LED16.4), RS232-Sheet (R335.2)
LED10_DOUT: Top-Sheet (TP6.1), RS485-Sheet (R353.2)
OSC_EN: ESP32_Sheet (R43.2), Ethernet-Sheet (R127.2 X1.1)
REF_CLK_50M_I: ESP32_Sheet (R23.1), Ethernet-Sheet (R143.1 R144.2)
REF_CLK_50M_O: ESP32_Sheet (R24.1 R25.1), Ethernet-Sheet (R141.2 R142.2 R143.2)
ROUT_1: Controller-Sheet-2 (R170.1), RS232-Sheet (R322.2 U25.6)
ROUT_2: Controller-Sheet-3 (R210.2), RS232-Sheet (R331.2 U26.6)
RSTN: ESP32_Sheet (R42.2), Ethernet-Sheet (R105.2 U14.47)
RXD_0: ESP32_Sheet (R33.1), Ethernet-Sheet (R124.1)
RXD_1: ESP32_Sheet (R34.1), Ethernet-Sheet (R125.1)
SCL_MDC: ESP32_Sheet (R37.2), Ethernet-Sheet (U14.36 U15.6)
SDA_MDIO: ESP32_Sheet (R36.2), Ethernet-Sheet (U14.37 U15.5)
SPI4_MISO: Display-Sheet (R83.1), Controller-Sheet-3 (R209.1)
SPI4_MOSI: Display-Sheet (R82.1), Controller-Sheet-3 (R211.1)
SPI4_NSS: Display-Sheet (R78.1), Controller-Sheet-3 (R207.1)
SPI4_SCK: Display-Sheet (R80.1), Controller-Sheet-3 (R206.1)
SPIQ: ESP32_Sheet (R39.2), Ethernet-Sheet (SW8.1 U14.38)
SPISN: ESP32_Sheet (R38.2), Ethernet-Sheet (U14.39)
TX_EN: ESP32_Sheet (R26.1), Ethernet-Sheet (U14.16)
TXD_0: ESP32_Sheet (R29.1), Ethernet-Sheet (U14.20)
TXD_1: ESP32_Sheet (R30.1), Ethernet-Sheet (U14.19)
UART4_RX: Controller-Sheet-2 (R196.2), STM32-USB-Sheet (R273.2)
UART4_TX: Controller-Sheet-2 (R195.2), STM32-USB-Sheet (R271.2)
USB_FS_ID: Controller-Sheet-2 (R175.2), STM32-USB-Sheet (D18.1 J16.4)
USB_FS_N: Controller-Sheet-2 (R178.2), STM32-USB-Sheet (U19.1)
USB_FS_OVCR: Controller-Sheet-3 (R241.1), STM32-USB-Sheet (LED7.2 R262.1 U18.3)
USB_FS_P: Controller-Sheet-2 (R179.2), STM32-USB-Sheet (U19.3)
USB_FS_PWR_EN: Controller-Sheet-3 (R217.2), STM32-USB-Sheet (R264.1 U18.4)
USB_FS_VBUS: Controller-Sheet-2 (R173.2), STM32-USB-Sheet (5 pins)